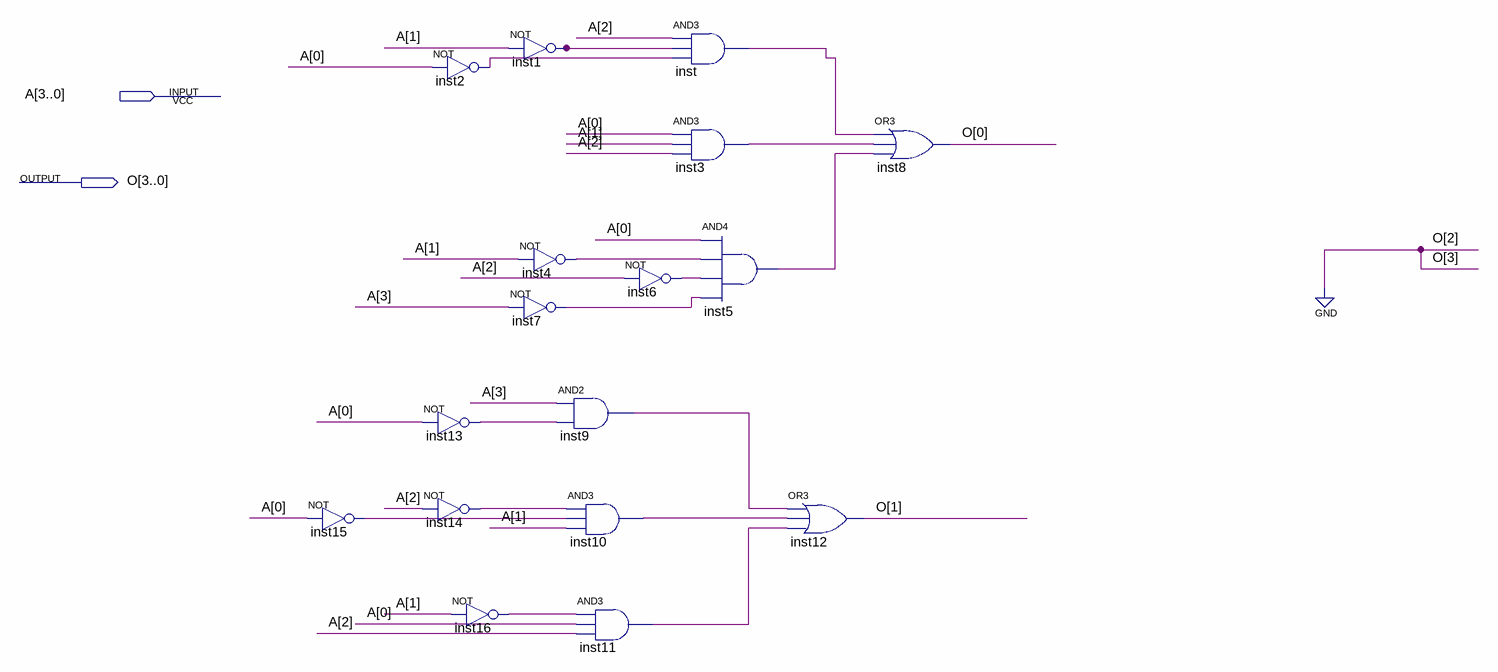
[diagram p0: schematic sheet]
// Quartus schematic rem.bdf as structural Verilog: 17 symbols, 2 pins
module rem (
  input  [3:0] A,
  output [3:0] O
);

  wire inst1_out, inst2_out, inst3_out, inst4_out, inst5_out, inst6_out, inst7_out, inst9_out, inst10_out,
       inst11_out, inst13_out, inst14_out, inst15_out, inst16_out, inst_out;

  not inst15 (inst15_out, A[0]);
  not inst2 (inst2_out, A[0]);
  not inst13 (inst13_out, A[0]);
  not inst14 (inst14_out, A[2]);
  not inst16 (inst16_out, A[1]);
  not inst1 (inst1_out, A[1]);
  not inst4 (inst4_out, A[1]);
  not inst7 (inst7_out, A[3]);
  not inst6 (inst6_out, A[2]);
  and inst9 (inst9_out, A[3], inst13_out);
  and inst10 (inst10_out, inst14_out, inst15_out, A[1]);
  and inst11 (inst11_out, inst16_out, A[0], A[2]);
  and inst (inst_out, A[2], inst1_out, inst2_out);
  and inst3 (inst3_out, A[0], A[1], A[2]);
  and inst5 (inst5_out, A[0], inst4_out, inst6_out, inst7_out);
  or inst12 (O[1], inst9_out, inst10_out, inst11_out);
  or inst8 (O[0], inst_out, inst3_out, inst5_out);

  assign O[3:2] = 2'b00;
endmodule
